# Altium schematic sheet Top-Sheet.SchDoc
size A4; SheetNumber: 1; SheetTotal: 12
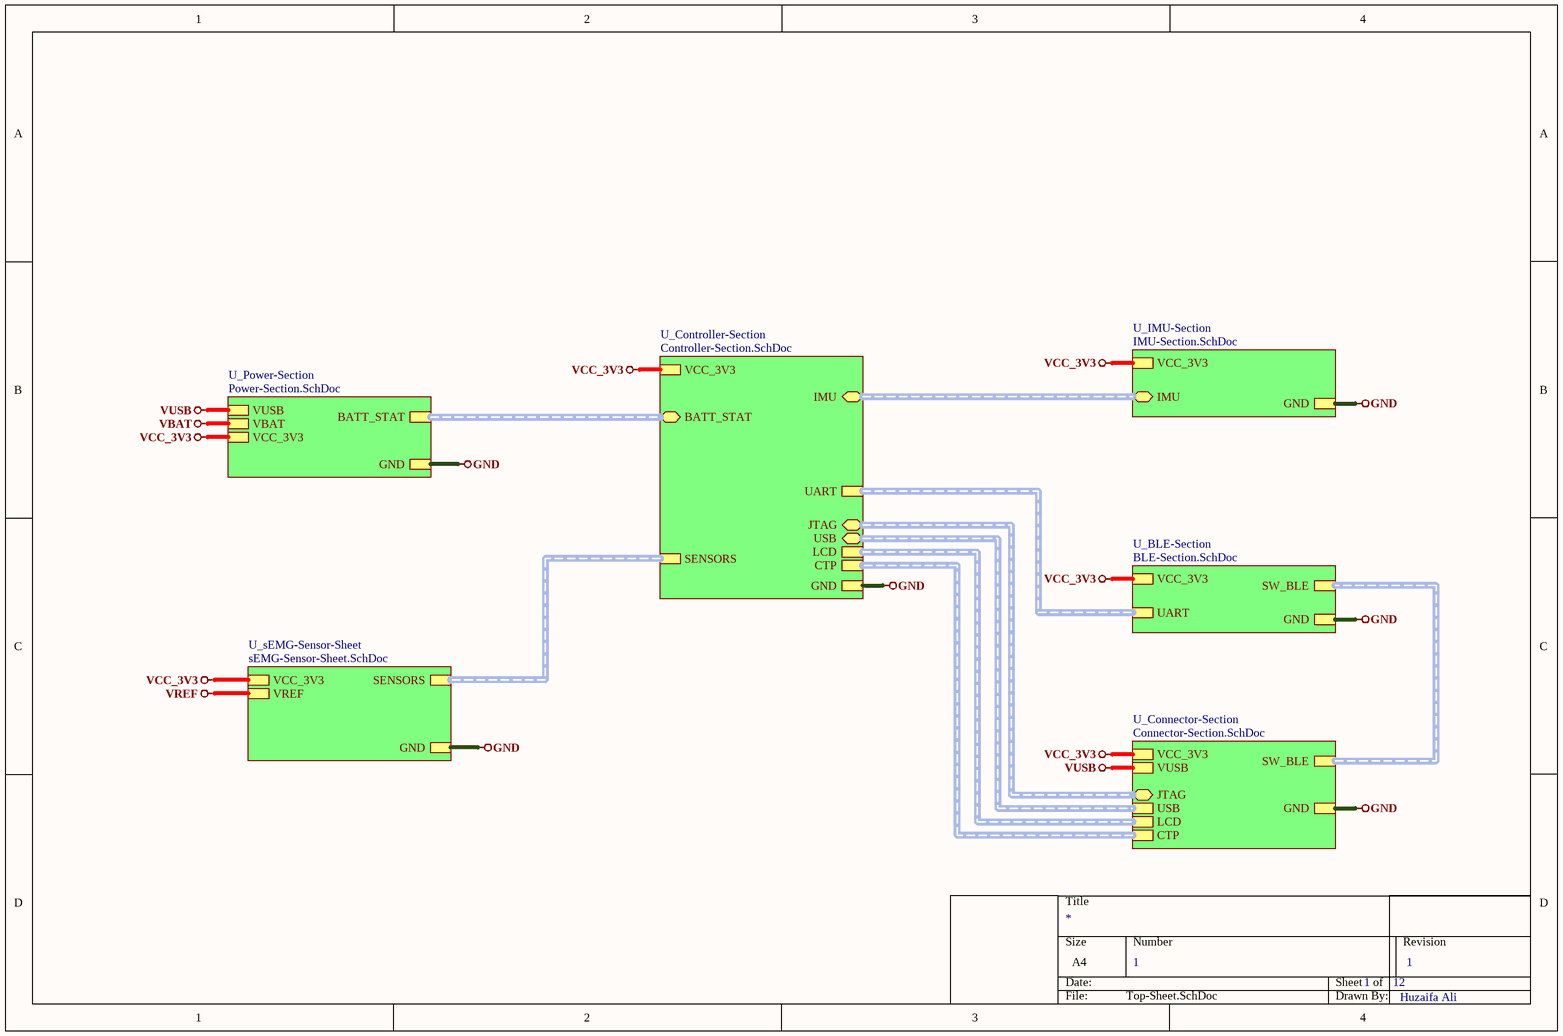
[diagram p0: Top-Sheet.SchDoc]

## Sub-sheets
U_BLE-Section = BLE-Section.SchDoc: UART (harness UART), SW_BLE (harness SW_BLE), VCC_3V3, GND
U_Connector-Section = Connector-Section.SchDoc: SW_BLE (harness SW_BLE), USB (harness USB), VCC_3V3, GND, VUSB, JTAG (bidir, harness JTAG), LCD (harness LCD), CTP (harness CTP)
U_Controller-Section = Controller-Section.SchDoc: BATT_STAT (bidir, harness BATT_STAT), IMU (bidir, harness IMU), USB (bidir, harness USB), VCC_3V3, GND, UART (harness UART), JTAG (bidir, harness JTAG), LCD (harness LCD), CTP (harness CTP), SENSORS (harness SENSORS)
U_IMU-Section = IMU-Section.SchDoc: IMU (bidir, harness IMU), VCC_3V3, GND
U_Power-Section = Power-Section.SchDoc: VUSB, GND, VBAT, VCC_3V3, BATT_STAT (harness BATT_STAT)
U_sEMG-Sensor-Sheet = sEMG-Sensor-Sheet.SchDoc: VCC_3V3, GND, VREF, SENSORS (harness SENSORS)

## Nets
GND: sheet U_Power-Section/GND, sheet U_Controller-Section/GND, sheet U_IMU-Section/GND, sheet U_BLE-Section/GND, sheet U_Connector-Section/GND, sheet U_sEMG-Sensor-Sheet/GND
VBAT: sheet U_Power-Section/VBAT
VCC_3V3: sheet U_Power-Section/VCC_3V3, sheet U_Controller-Section/VCC_3V3, sheet U_IMU-Section/VCC_3V3, sheet U_BLE-Section/VCC_3V3, sheet U_Connector-Section/VCC_3V3, sheet U_sEMG-Sensor-Sheet/VCC_3V3
VREF: sheet U_sEMG-Sensor-Sheet/VREF
VUSB: sheet U_Power-Section/VUSB, sheet U_Connector-Section/VUSB

## Buses and harness runs
harness sheet U_BLE-Section/SW_BLE = sheet U_Connector-Section/SW_BLE
harness sheet U_BLE-Section/UART = sheet U_Controller-Section/UART
harness sheet U_Connector-Section/CTP = sheet U_Controller-Section/CTP
harness sheet U_Connector-Section/JTAG = sheet U_Controller-Section/JTAG
harness sheet U_Connector-Section/LCD = sheet U_Controller-Section/LCD
harness sheet U_Connector-Section/USB = sheet U_Controller-Section/USB
harness sheet U_Controller-Section/BATT_STAT = sheet U_Power-Section/BATT_STAT
harness sheet U_Controller-Section/IMU = sheet U_IMU-Section/IMU
harness sheet U_Controller-Section/SENSORS = sheet U_sEMG-Sensor-Sheet/SENSORS

## Notes on the sheet
- 1
- Huzaifa Ali